# Altium schematic sheet 07_EXPANSION.SchDoc
size A4; SheetNumber: 7; SheetTotal: 7
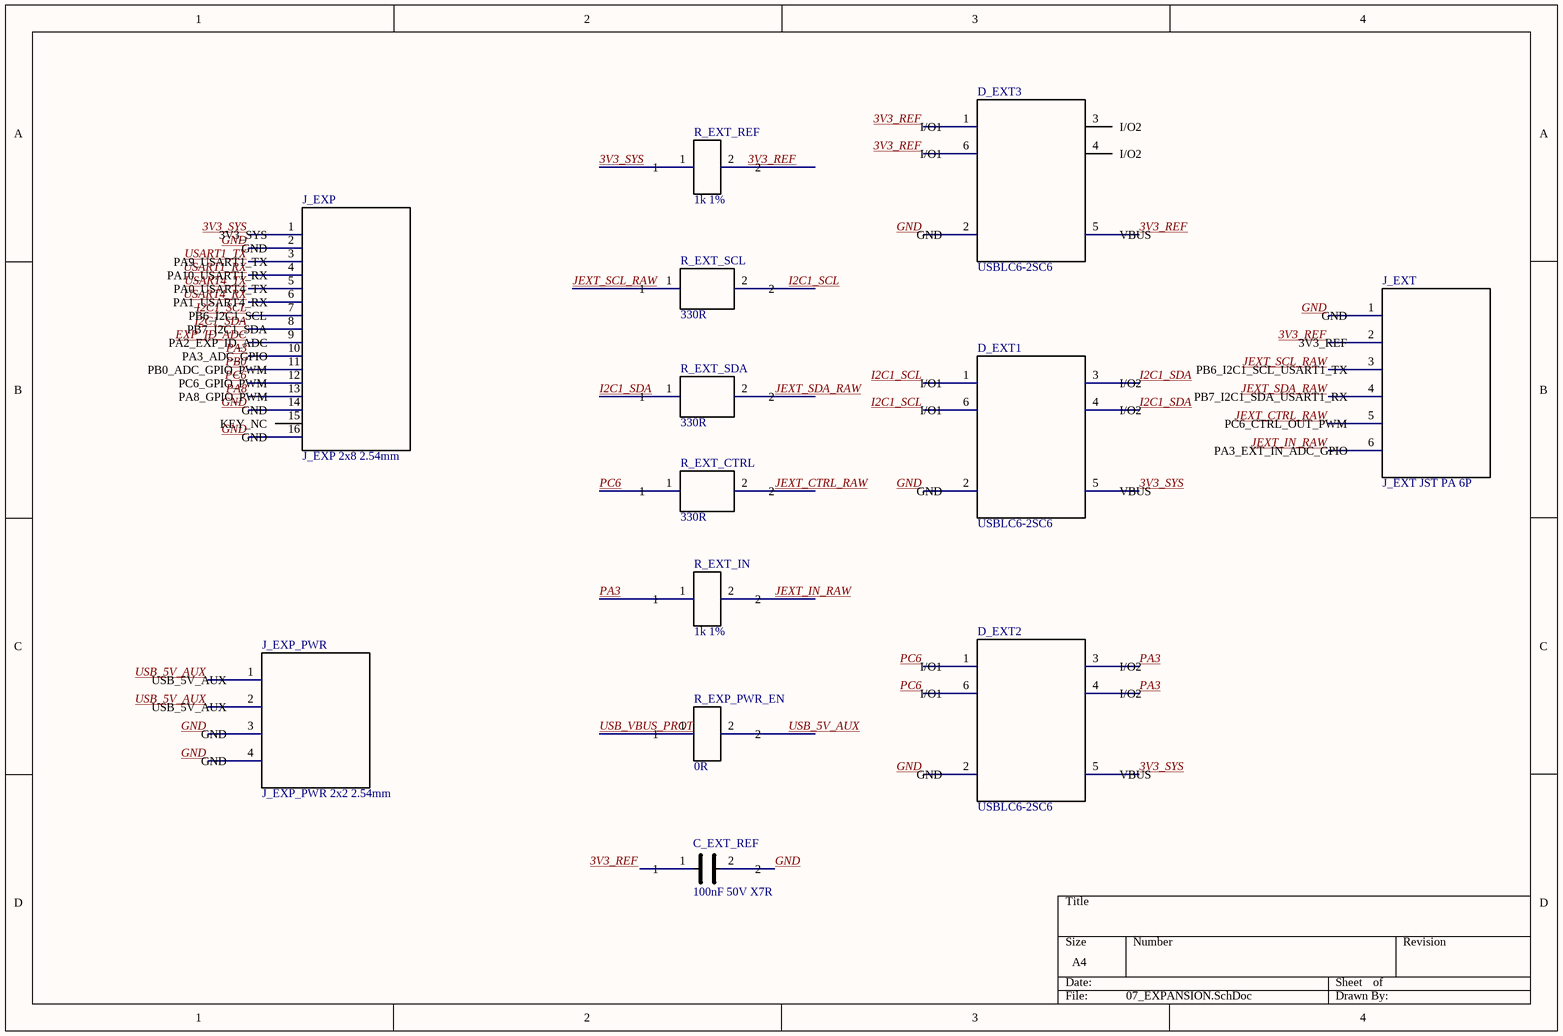
[diagram p0: 07_EXPANSION.SchDoc]

## Parts
C_EXT_REF  100nF 50V X7R  [SAMSUNG_CL10_0603_CAP_2P]
D_EXT1  USBLC6-2SC6  [ST_SOT23_6L_USBLC6_6P]
D_EXT2  USBLC6-2SC6  [ST_SOT23_6L_USBLC6_6P]
D_EXT3  USBLC6-2SC6  [ST_SOT23_6L_USBLC6_6P]
J_EXP  J_EXP 2x8 2.54mm  [GENERIC_HEADER_2X8_P2P54_THT]
J_EXP_PWR  J_EXP_PWR 2x2 2.54mm  [GENERIC_HEADER_2X2_P2P54_THT]
J_EXT  J_EXT JST PA 6P  [JST_PA_B06B_PASK_1N_6P_THT]
R_EXP_PWR_EN  0R  [RES_0603_SHARED_2P]
R_EXT_CTRL  330R  [RES_0603_SHARED_2P]
R_EXT_IN  1k 1%  [RES_0805_SHARED_2P]
R_EXT_REF  1k 1%  [RES_0805_SHARED_2P]
R_EXT_SCL  330R  [RES_0603_SHARED_2P]
R_EXT_SDA  330R  [RES_0603_SHARED_2P]

## Nets
3V3_REF: C_EXT_REF.1 D_EXT3.1(I/O1) D_EXT3.5(VBUS) D_EXT3.6(I/O1) J_EXT.2(3V3_REF) R_EXT_REF.2
3V3_SYS: D_EXT1.5(VBUS) D_EXT2.5(VBUS) J_EXP.1(3V3_SYS) R_EXT_REF.1
EXP_ID_ADC: J_EXP.9(PA2_EXP_ID_ADC)
GND: C_EXT_REF.2 D_EXT1.2(GND) D_EXT2.2(GND) D_EXT3.2(GND) J_EXP.2(GND) J_EXP.14(GND) J_EXP.16(GND) J_EXP_PWR.3(GND) J_EXP_PWR.4(GND) J_EXT.1(GND)
I2C1_SCL: D_EXT1.1(I/O1) D_EXT1.6(I/O1) J_EXP.7(PB6_I2C1_SCL) R_EXT_SCL.2
I2C1_SDA: D_EXT1.3(I/O2) D_EXT1.4(I/O2) J_EXP.8(PB7_I2C1_SDA) R_EXT_SDA.1
JEXT_CTRL_RAW: J_EXT.5(PC6_CTRL_OUT_PWM) R_EXT_CTRL.2
JEXT_IN_RAW: J_EXT.6(PA3_EXT_IN_ADC_GPIO) R_EXT_IN.2
JEXT_SCL_RAW: J_EXT.3(PB6_I2C1_SCL_USART1_TX) R_EXT_SCL.1
JEXT_SDA_RAW: J_EXT.4(PB7_I2C1_SDA_USART1_RX) R_EXT_SDA.2
PA3: D_EXT2.3(I/O2) D_EXT2.4(I/O2) J_EXP.10(PA3_ADC_GPIO) R_EXT_IN.1
PA8: J_EXP.13(PA8_GPIO_PWM)
PB0: J_EXP.11(PB0_ADC_GPIO_PWM)
PC6: D_EXT2.1(I/O1) D_EXT2.6(I/O1) J_EXP.12(PC6_GPIO_PWM) R_EXT_CTRL.1
USART1_RX: J_EXP.4(PA10_USART1_RX)
USART1_TX: J_EXP.3(PA9_USART1_TX)
USART4_RX: J_EXP.6(PA1_USART4_RX)
USART4_TX: J_EXP.5(PA0_USART4_TX)
USB_5V_AUX: J_EXP_PWR.1(USB_5V_AUX) J_EXP_PWR.2(USB_5V_AUX) R_EXP_PWR_EN.2
USB_VBUS_PROT: R_EXP_PWR_EN.1

Not connected (* = marked no-connect by the designer): D_EXT3 3(I/O2) 4(I/O2); J_EXP 15(KEY_NC)

## Library data of the parts
C_EXT_REF = CL10B104KB8NNNC: MCU-core ceramic capacitor; Manufacturer: Samsung Electro-Mechanics; Source_Baseline: MCU_SCHEMATIC_ENTRY_BASELINE_v2.1_FA.txt; Design_Status: DESIGN_LOCK_MCU_CORE_V2.1_FOOTPRINT_HOLD; Qualification_Status: UNQUALIFIED_PENDING_SAVE_REOPEN_AUDIT; PIN_NUMBER_SOURCE: INTERNAL_CONVENTION; PIN_FUNCTION_SOURCE: MANUFACTURER_DATASHEET; MPN: CL10B104KB8NNNC; Value: 100nF 50V X7R; Package: 0603 / 1608 metric; Datasheet: https://product.samsungsem.com/mlcc/CL10B104KB8NNN.do
D_EXT1-D_EXT3 = USBLC6-2SC6: Two-line low-capacitance ESD protector; ST device purchased for Rev-A; Manufacturer: STMicroelectronics; Source_Baseline: MICROSD_SCHEMATIC_ENTRY_BASELINE_v1.2_FA.txt; Design_Status: DESIGN_LOCK_MICROSD_V1.2_ST_PROCUREMENT; Qualification_Status: UNQUALIFIED_PENDING_SAVE_REOPEN_AUDIT; PIN_NUMBER_SOURCE: MANUFACTURER_DATASHEET; MPN: USBLC6-2SC6; Value: USBLC6-2SC6; Package: SOT23-6L; Datasheet: https://www.st.com/resource/en/datasheet/usblc6-2.pdf; PIN_FUNCTION_SOURCE: MANUFACTURER_DATASHEET
J_EXP = J_EXP_2X8_MALE_P2P54_THT: Internal rigid daughterboard expansion header; generic 2x8 male vertical THT; position 15 is KEY/NC and metal pin 15 shall be physically removed; MPN: 2X8-MALE-P2P54-THT; Procurement: Iran generic 2.54mm double-row male header; Lion PLD-2.54-2X40GF may be cut to 2x8; equivalent allowed; Mechanical_Key: POSITION_15_NO_METAL_PIN; mating female cavity 15 shall be blocked; Source_Baseline: T21_EXPANSION_DECISIONS_2026-08-28 + Expansion Architecture RevA v1.0; Design_Status: T21_LOCK; Qualification_Status: GENERIC_GEOMETRY_LOCKED_PHYSICAL_SAMPLE_FIT_PENDING; PIN_NUMBER_SOURCE: PROJECT_PHYSICAL_NUMBERING_LOCK_T21; PIN_FUNCTION_SOURCE: EXPANSION_ARCHITECTURE_REVA_V1.0_PLUS_T21_DECISIONS; Manufacturer: GENERIC; Value: J_EXP 2x8 2.54mm; Package: THT 2x8 pitch 2.54 mm
J_EXP_PWR = J_EXP_PWR_2X2_MALE_P2P54_THT: Internal daughterboard auxiliary power header; USB_5V_AUX output-only; valid only with rigid J_EXP mating so J_EXP key enforces orientation; Manufacturer: GENERIC; MPN: 2X2-MALE-P2P54-THT; Procurement: Iran generic 2.54mm double-row male header; cut from longer strip allowed; Usage_Policy: RIGID_DAUGHTERBOARD_ONLY; NOT_FOR_STANDALONE_CABLE; OUTPUT_ONLY; NO_BACKFEED; Source_Baseline: T21_EXPANSION_DECISIONS_2026-08-28 + Expansion Architecture RevA v1.0; Design_Status: T21_LOCK; Qualification_Status: GENERIC_GEOMETRY_LOCKED; PIN_NUMBER_SOURCE: PROJECT_PHYSICAL_NUMBERING_LOCK_T21; PIN_FUNCTION_SOURCE: EXPANSION_ARCHITECTURE_REVA_V1.0; Value: J_EXP_PWR 2x2 2.54mm; Package: THT 2x2 pitch 2.54 mm
J_EXT = B06B-PASK-1N: Protected external signal expansion port; JST PA 6-pin top-entry THT with boss; external modules are self-powered except low-current 3V3_REF; Value: JST PA 6P 2.0mm; Mating_Housing: PAP-06V-S; Port_Policy: SIGNAL_PORT; EXTERNAL_MODULES_SELF_POWERED; PIN2_3V3_REF_NOT_POWER_OUTPUT; Source_Baseline: T21_EXPANSION_DECISIONS_2026-08-28 + JST official PA family; Design_Status: T21_LOCK; Qualification_Status: MECHANICAL_DATASHEET_LOCKED_PHYSICAL_SAMPLE_FIT_PENDING; PIN_NUMBER_SOURCE: JST_CIRCUIT_NUMBERING; PIN_FUNCTION_SOURCE: T21_JEXT_SIGNAL_PORT_LOCK_2026-08-28; Manufacturer: JST; MPN: B06B-PASK-1N; Package: PA family top-entry N type THT with boss, 6 circuits, 2.0 mm pitch; Datasheet: JST PA FAMILY ePA-F.pdf; B06B-PASK-1N
R_EXP_PWR_EN = SER0603J0R: Zero-ohm mode strap; Manufacturer: VICO / Anhui Xiangsheng Technology; Source_Baseline: POWER_SCHEMATIC_ENTRY_BASELINE_v0.17_FA.txt; Design_Status: DESIGN_LOCK_V0.17; Qualification_Status: UNQUALIFIED_PENDING_SAVE_REOPEN_AUDIT; PIN_NUMBER_SOURCE: INTERNAL_CONVENTION; PIN_FUNCTION_SOURCE: MANUFACTURER_DATASHEET; MPN: SER0603J0R; Value: 0R; Package: 0603; Datasheet: SER0603J0R-VO-Sub-Brand-(ER).pdf
R_EXT_CTRL R_EXT_SCL R_EXT_SDA = 0603WAF3300T5E: External-port series resistor; 330 ohm 1% 100mW 0603; Manufacturer: UNI-ROYAL; Value: 330R 1%; Source_Baseline: T21_JEXT_PROTECTION_LOCK_2026-08-28; Design_Status: T21_LOCK; Qualification_Status: CONTROLLED; PIN_NUMBER_SOURCE: INTERNAL_CONVENTION; PIN_FUNCTION_SOURCE: PASSIVE_RESISTOR; MPN: 0603WAF3300T5E; Package: 0603; Power: 100mW; Datasheet: UNI-ROYAL 0603WAF3300T5E / LCSC C23138
R_EXT_IN R_EXT_REF = 0805W8F1001T5E: OVP series resistor; Manufacturer: UNI-ROYAL; Source_Baseline: POWER_SCHEMATIC_ENTRY_BASELINE_v0.17_FA.txt; Design_Status: CONTROLLED_V0.17_P9; Qualification_Status: UNQUALIFIED_PENDING_SAVE_REOPEN_AUDIT; PIN_NUMBER_SOURCE: INTERNAL_CONVENTION; PIN_FUNCTION_SOURCE: MANUFACTURER_DATASHEET; MPN: 0805W8F1001T5E; Value: 1k 1%; Package: 0805; Datasheet: UNI-ROYAL manufacturer resistor data